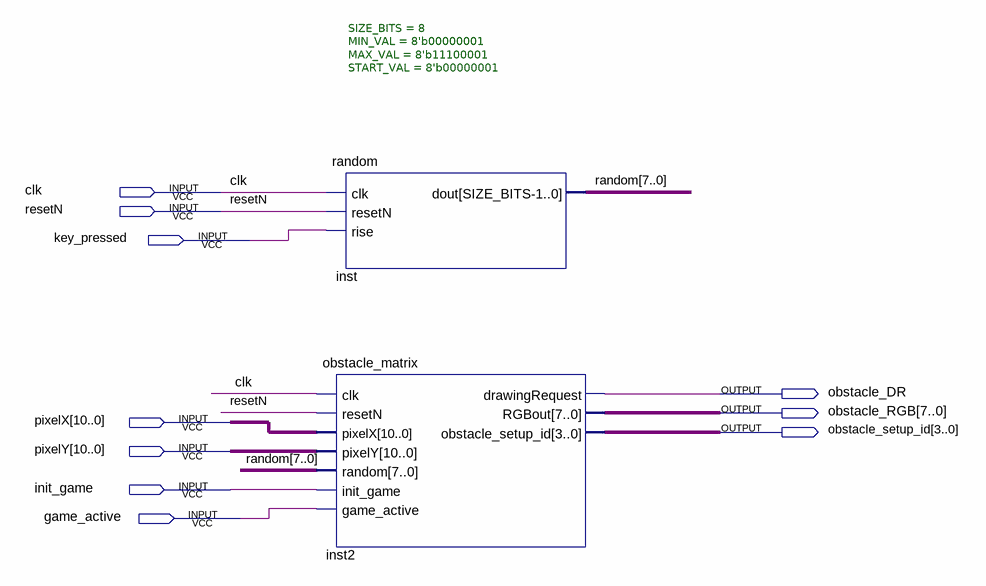
[diagram p0: schematic sheet]
// Quartus schematic obstacles_display.bdf as structural Verilog: 2 symbols, 10 pins
module obstacles_display (
  input  clk,
  input  resetN,
  input  key_pressed,
  input  [10:0] pixelX,
  input  [10:0] pixelY,
  input  init_game,
  input  game_active,
  output obstacle_DR,
  output [7:0] obstacle_RGB,
  output [3:0] obstacle_setup_id
);

  wire [7:0] random;

  obstacle_matrix inst2 (
    .clk(clk), .resetN(resetN), .pixelX(pixelX), .pixelY(pixelY), .random(random), .init_game(init_game),
    .game_active(game_active), .drawingRequest(obstacle_DR), .RGBout(obstacle_RGB),
    .obstacle_setup_id(obstacle_setup_id));
  random #(.SIZE_BITS(8), .MIN_VAL(8'b00000001), .MAX_VAL(8'b11100001), .START_VAL(8'b00000001)) inst (
    .clk(clk), .resetN(resetN), .rise(key_pressed), .dout(random));
endmodule
